# Altium project Triple 1S Battery Charger.PrjPcb
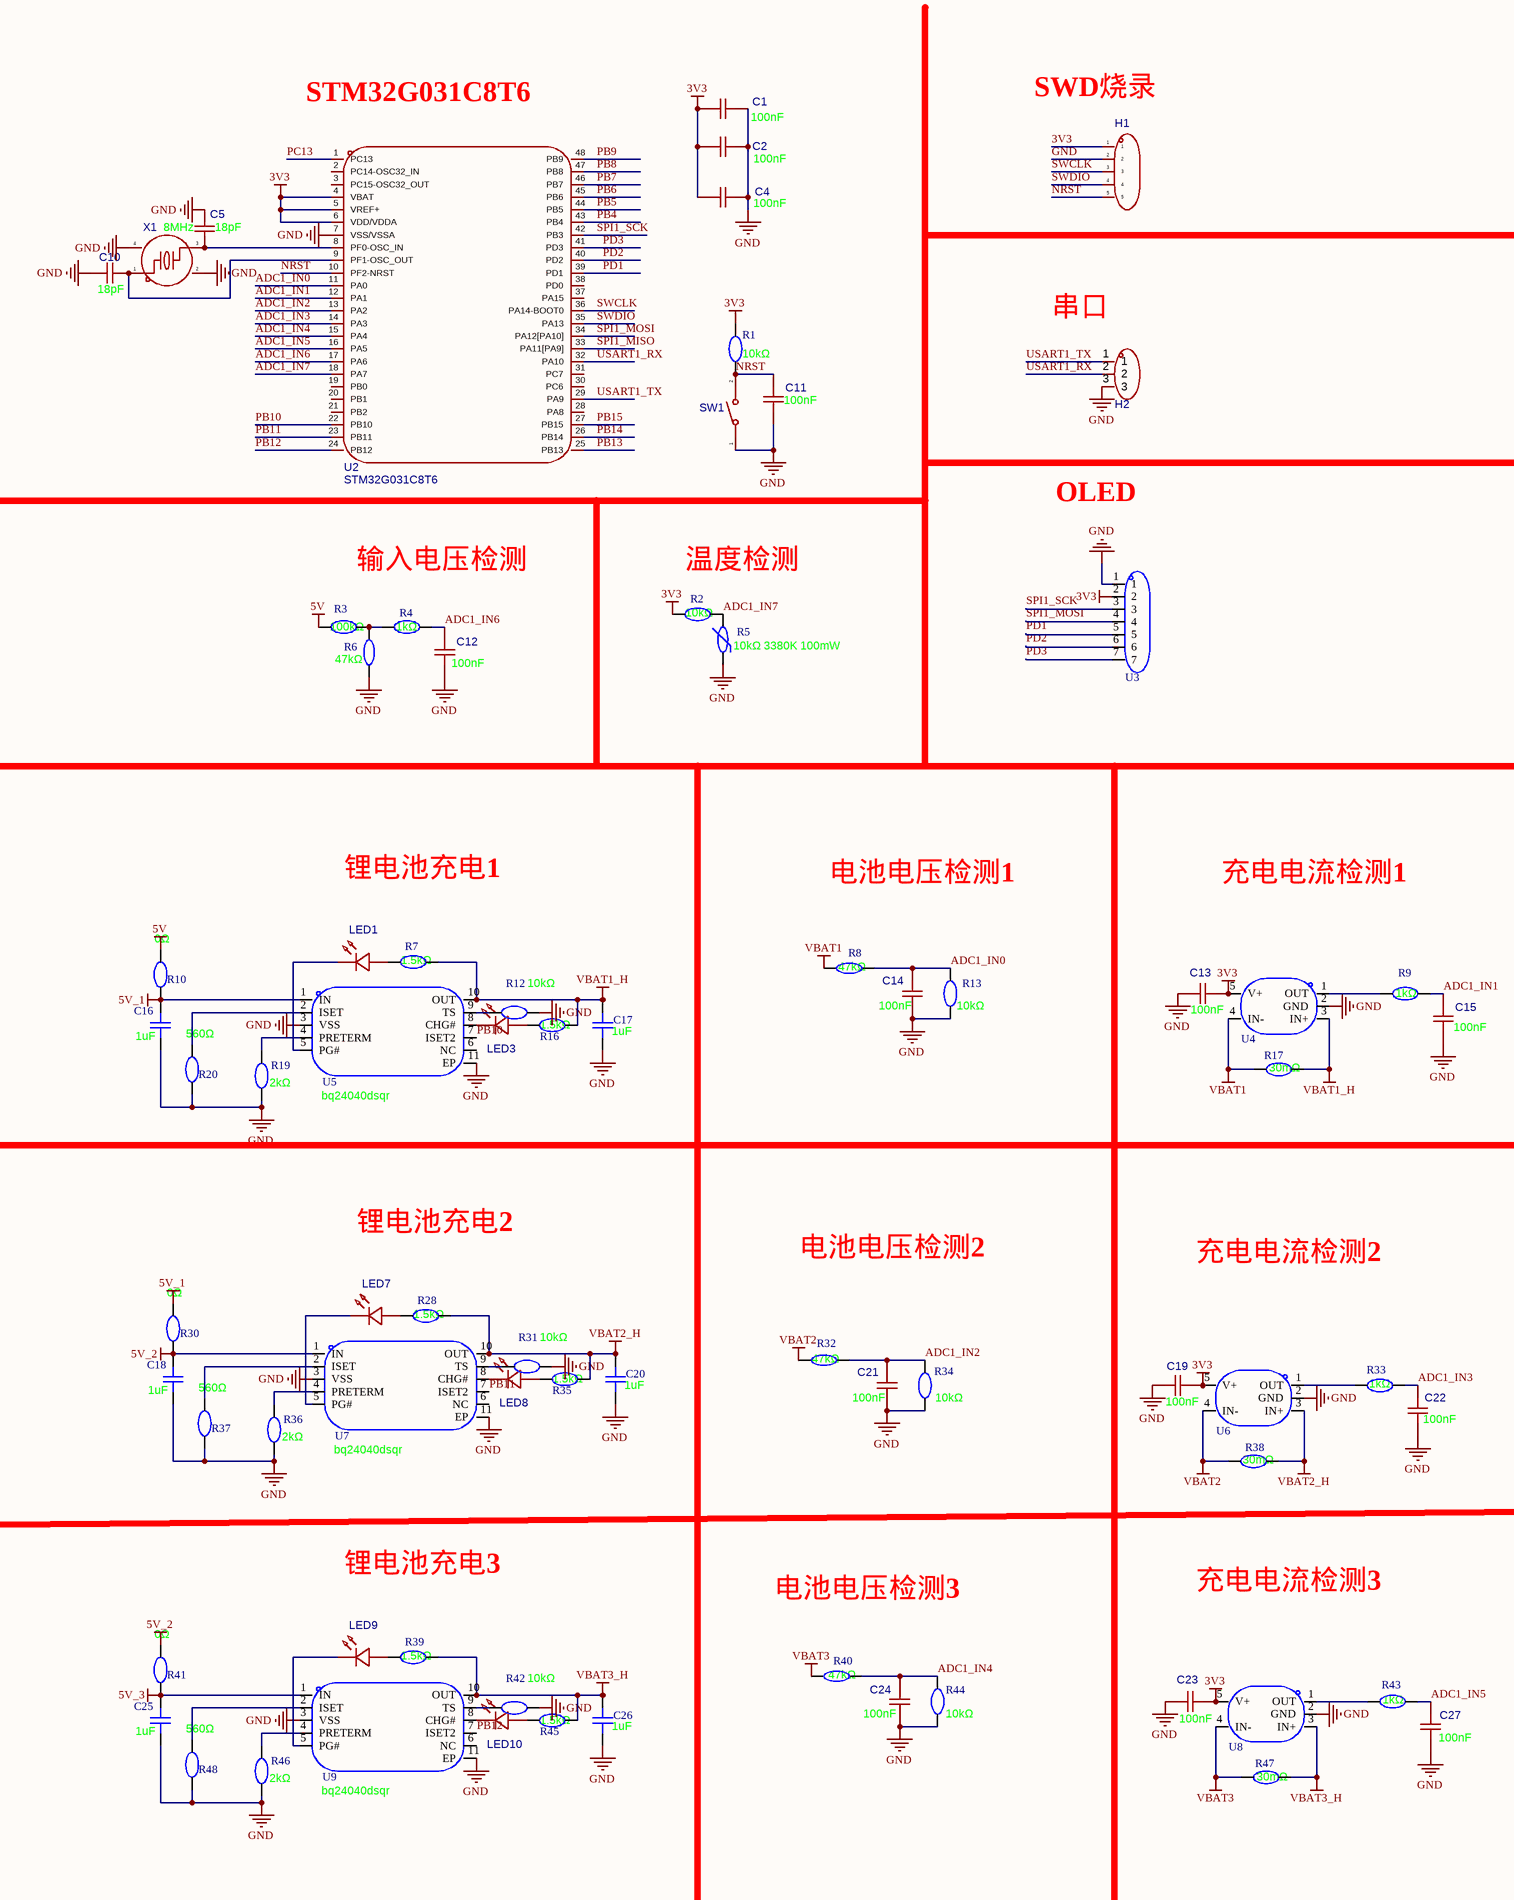
[diagram p0: Sheet1.SchDoc, left]
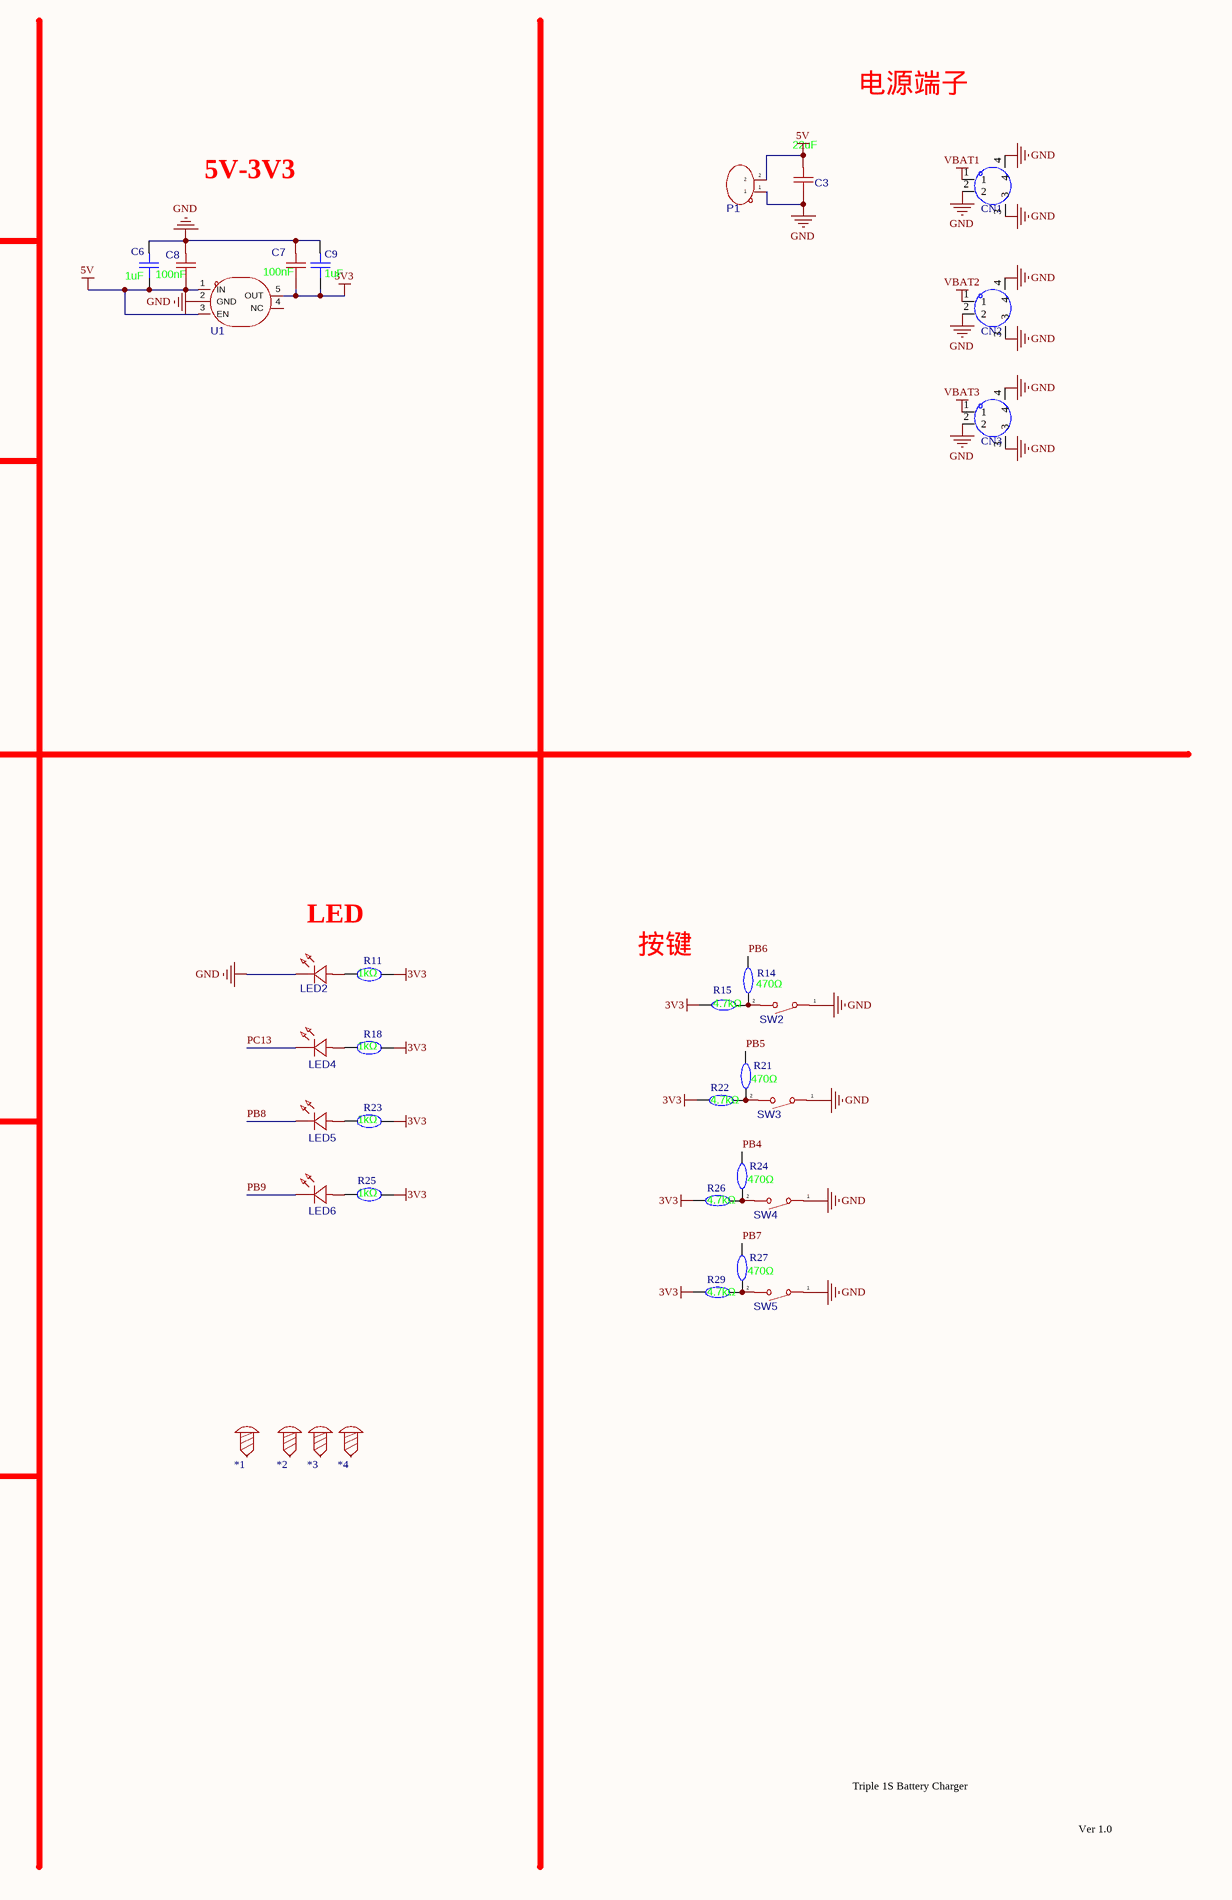
[diagram p1: Sheet1.SchDoc, right]
1 sheet, 110 parts. Net scope: global (net labels, ports and power ports of the same name join across sheets).
Board file: PCB1.PcbDoc

## Sheet Sheet1.SchDoc
size A2; SheetNumber: 1; SheetTotal: 1

### Parts
*1  螺丝孔_1  [M3螺丝]  (value not drawn)
*2  螺丝孔_1  [M3螺丝]  (value not drawn)
*3  螺丝孔_1  [M3螺丝]  (value not drawn)
*4  螺丝孔_1  [M3螺丝]  (value not drawn)
C1  value 100nF  [C0402]  (hidden comment: cc0402krx7r7bb104)
C2  value 100nF  [C0402]  (hidden comment: cc0402krx7r7bb104)
C3  value 22uF  [C0603]  (hidden comment: hgc0603r5226m160nthj)
C4  value 100nF  [C0402]  (hidden comment: cc0402krx7r7bb104)
C5  value 18pF  [C0402]  (hidden comment: cc0402jrnpo9bn180)
C6  value 1uF  [C0402]  (hidden comment: cga0402x5r105k500gt)
C7  value 100nF  [C0402]  (hidden comment: cc0402krx7r7bb104)
C8  value 100nF  [C0402]  (hidden comment: cc0402krx7r7bb104)
C9  value 1uF  [C0402]  (hidden comment: cga0402x5r105k500gt)
C10  value 18pF  [C0402]  (hidden comment: cc0402jrnpo9bn180)
C11  value 100nF  [C0402]  (hidden comment: cc0402krx7r7bb104)
C12  value 100nF  [C0402]  (hidden comment: cc0402krx7r7bb104)
C13  value 100nF  [C0402]  (hidden comment: cc0402krx7r7bb104)
C14  value 100nF  [C0402]  (hidden comment: cc0402krx7r7bb104)
C15  value 100nF  [C0402]  (hidden comment: cc0402krx7r7bb104)
C16  value 1uF  [C0402]  (hidden comment: cga0402x5r105k500gt)
C17  value 1uF  [C0402]  (hidden comment: cga0402x5r105k500gt)
C18  value 1uF  [C0402]  (hidden comment: cga0402x5r105k500gt)
C19  value 100nF  [C0402]  (hidden comment: cc0402krx7r7bb104)
C20  value 1uF  [C0402]  (hidden comment: cga0402x5r105k500gt)
C21  value 100nF  [C0402]  (hidden comment: cc0402krx7r7bb104)
C22  value 100nF  [C0402]  (hidden comment: cc0402krx7r7bb104)
C23  value 100nF  [C0402]  (hidden comment: cc0402krx7r7bb104)
C24  value 100nF  [C0402]  (hidden comment: cc0402krx7r7bb104)
C25  value 1uF  [C0402]  (hidden comment: cga0402x5r105k500gt)
C26  value 1uF  [C0402]  (hidden comment: cga0402x5r105k500gt)
C27  value 100nF  [C0402]  (hidden comment: cc0402krx7r7bb104)
CN1  2.54-2a-lt  [CONN-SMD_2P-P2.54_XH2.54-2AB]  (value not drawn)
CN2  2.54-2a-lt  [CONN-SMD_2P-P2.54_XH2.54-2AB]  (value not drawn)
CN3  2.54-2a-lt  [CONN-SMD_2P-P2.54_XH2.54-2AB]  (value not drawn)
H1  pz254v-11-05p  [HDR-TH_5P-P2.54-V-M]  (value not drawn)
H2  lail-pz2.54-3p-l  [HDR-TH_3P-P2.54-V-M-1]  (value not drawn)
LED1  xl-1005ugc_c965793  [LED0402-RD_GREEN]  (value not drawn)
LED2  xl-1005ugc_c965793  [LED0402-RD_GREEN]  (value not drawn)
LED3  xl-1005ugc_c965793  [LED0402-RD_GREEN]  (value not drawn)
LED4  xl-1005ugc_c965793  [LED0402-RD_GREEN]  (value not drawn)
LED5  xl-1005ugc_c965793  [LED0402-RD_GREEN]  (value not drawn)
LED6  xl-1005ugc_c965793  [LED0402-RD_GREEN]  (value not drawn)
LED7  xl-1005ugc_c965793  [LED0402-RD_GREEN]  (value not drawn)
LED8  xl-1005ugc_c965793  [LED0402-RD_GREEN]  (value not drawn)
LED9  xl-1005ugc_c965793  [LED0402-RD_GREEN]  (value not drawn)
LED10  xl-1005ugc_c965793  [LED0402-RD_GREEN]  (value not drawn)
P1  wj15edgrc-3.81-02p-14-00a  [CONN-TH_2P-P3.81_WJ15EDGRC-3.81-2P]  (value not drawn)
R1  value 10kΩ  [R0402]  (hidden comment: frc0402f1002ts)
R2  value 10kΩ  [R0402]  (hidden comment: frc0402f1002ts)
R3  value 100kΩ  [R0402]  (hidden comment: frc0402f1003ts)
R4  value 1kΩ  [R0402]  (hidden comment: frc0402j102 ts)
R5  LCSC Part Name: 10kΩ 3380K 100mW  [R0402]  (hidden comment: ncp15xh103f03rc)
R6  value 47kΩ  [R0402]  (hidden comment: 0402wgf4702tce)
R7  value 1.5kΩ  [R0402]  (hidden comment: frc0402f1501ts)
R8  value 47kΩ  [R0402]  (hidden comment: 0402wgf4702tce)
R9  value 1kΩ  [R0402]  (hidden comment: frc0402j102 ts)
R10  value 0Ω  [R1206]  (hidden comment: re1206f1r000)
R11  value 1kΩ  [R0402]  (hidden comment: frc0402j102 ts)
R12  value 10kΩ  [R0402]  (hidden comment: frc0402f1002ts)
R13  value 10kΩ  [R0402]  (hidden comment: frc0402f1002ts)
R14  value 470Ω  [R0402]  (hidden comment: 0402wgf4700tce)
R15  value 4.7kΩ  [R0402]  (hidden comment: rc0402fr-074k7l)
R16  value 1.5kΩ  [R0402]  (hidden comment: frc0402f1501ts)
R17  value 30mΩ  [R0805]  (hidden comment: re0805far030)
R18  value 1kΩ  [R0402]  (hidden comment: frc0402j102 ts)
R19  value 2kΩ  [R0402]  (hidden comment: frc0402f2001ts)
R20  value 560Ω  [R0402]  (hidden comment: frc0402f5600ts)
R21  value 470Ω  [R0402]  (hidden comment: 0402wgf4700tce)
R22  value 4.7kΩ  [R0402]  (hidden comment: rc0402fr-074k7l)
R23  value 1kΩ  [R0402]  (hidden comment: frc0402j102 ts)
R24  value 470Ω  [R0402]  (hidden comment: 0402wgf4700tce)
R25  value 1kΩ  [R0402]  (hidden comment: frc0402j102 ts)
R26  value 4.7kΩ  [R0402]  (hidden comment: rc0402fr-074k7l)
R27  value 470Ω  [R0402]  (hidden comment: 0402wgf4700tce)
R28  value 1.5kΩ  [R0402]  (hidden comment: frc0402f1501ts)
R29  value 4.7kΩ  [R0402]  (hidden comment: rc0402fr-074k7l)
R30  value 0Ω  [R1206]  (hidden comment: re1206f1r000)
R31  value 10kΩ  [R0402]  (hidden comment: frc0402f1002ts)
R32  value 47kΩ  [R0402]  (hidden comment: 0402wgf4702tce)
R33  value 1kΩ  [R0402]  (hidden comment: frc0402j102 ts)
R34  value 10kΩ  [R0402]  (hidden comment: frc0402f1002ts)
R35  value 1.5kΩ  [R0402]  (hidden comment: frc0402f1501ts)
R36  value 2kΩ  [R0402]  (hidden comment: frc0402f2001ts)
R37  value 560Ω  [R0402]  (hidden comment: frc0402f5600ts)
R38  value 30mΩ  [R0805]  (hidden comment: re0805far030)
R39  value 1.5kΩ  [R0402]  (hidden comment: frc0402f1501ts)
R40  value 47kΩ  [R0402]  (hidden comment: 0402wgf4702tce)
R41  value 0Ω  [R1206]  (hidden comment: re1206f1r000)
R42  value 10kΩ  [R0402]  (hidden comment: frc0402f1002ts)
R43  value 1kΩ  [R0402]  (hidden comment: frc0402j102 ts)
R44  value 10kΩ  [R0402]  (hidden comment: frc0402f1002ts)
R45  value 1.5kΩ  [R0402]  (hidden comment: frc0402f1501ts)
R46  value 2kΩ  [R0402]  (hidden comment: frc0402f2001ts)
R47  value 30mΩ  [R0805]  (hidden comment: re0805far030)
R48  value 560Ω  [R0402]  (hidden comment: frc0402f5600ts)
SW1  ts-1088-ar02016  [SW-SMD_L3.9-W3.0-P4.45]  (value not drawn)
SW2  ts-1088-ar02016  [SW-SMD_L3.9-W3.0-P4.45]  (value not drawn)
SW3  ts-1088-ar02016  [SW-SMD_L3.9-W3.0-P4.45]  (value not drawn)
SW4  ts-1088-ar02016  [SW-SMD_L3.9-W3.0-P4.45]  (value not drawn)
SW5  ts-1088-ar02016  [SW-SMD_L3.9-W3.0-P4.45]  (value not drawn)
U1  tps7a2033pdbvr  [SOT-23-5_L2.9-W1.6-P0.95-LS2.8-BR]  (value not drawn)
U2  stm32g031c8t6  [LQFP-48_L7.0-W7.0-P0.50-LS9.0-BL]
U3  kh-2.54fh-1x7p-h8.5  [HDR-TH_7P-P2.54-V-F]  (value not drawn)
U4  ina180a3idbvr  [SOT-23-5_L3.0-W1.7-P0.95-LS2.8-BR]  (value not drawn)
U5  bq24040dsqr  [WSON-10_L2.0-W2.0-P0.40-BL-EP]
U6  ina180a3idbvr  [SOT-23-5_L3.0-W1.7-P0.95-LS2.8-BR]  (value not drawn)
U7  bq24040dsqr  [WSON-10_L2.0-W2.0-P0.40-BL-EP]
U8  ina180a3idbvr  [SOT-23-5_L3.0-W1.7-P0.95-LS2.8-BR]  (value not drawn)
U9  bq24040dsqr  [WSON-10_L2.0-W2.0-P0.40-BL-EP]
X1  value 8MHz  [CRYSTAL-SMD_4P-L3.2-W2.5-BL]  (hidden comment: x32258mob4si)

### Nets
3V3: C1.1 C2.1 C4.1 C7.1 C9.1 C13.2 C19.2 C23.2 H1.1 R1.2 R2.1 R11.2 R15.1 R18.2 R22.1 R23.2 R25.2 R26.1 R29.1 U1.5(OUT) U2.4(VBAT) U2.5(VREF+) U2.6(VDD/VDDA) U3.2 U4.5(V+) U6.5(V+) U8.5(V+)
5V: C3.2 C6.1 C8.1 P1.2 R3.1 R10.2 U1.1(IN) U1.3(EN)
5V_1: C16.2 R10.1 R30.2 U5.1(IN)
5V_2: C18.2 R30.1 R41.2 U7.1(IN)
5V_3: C25.2 R41.1 U9.1(IN)
GND: C1.2 C2.2 C3.1 C4.2 C5.2 C6.2 C7.2 C8.2 C9.2 C10.1 C11.1 C12.1 C13.1 C14.2 C15.2 C16.1 C17.1 C18.1 C19.1 C20.1 C21.2 C22.2 C23.1 C24.2 C25.1 C26.1 C27.2 CN1.2 CN1.3 CN1.4 CN2.2 CN2.3 CN2.4 CN3.2 CN3.3 CN3.4 H1.2 H2.3 LED2.1(K) P1.1 R5.1 R6.1 R12.2 R13.2 R19.1 R20.1 R31.2 R34.2 R36.1 R37.1 R42.2 R44.2 R46.1 R48.1 SW1.1 SW2.1 SW3.1 SW4.1 SW5.1 U1.2(GND) U2.7(VSS/VSSA) U3.1 U4.2(GND) U5.3(VSS) U5.11(EP) U6.2(GND) U7.3(VSS) U7.11(EP) U8.2(GND) U9.3(VSS) U9.11(EP) X1.2(GND) X1.4(GND)
VBAT1: CN1.1 R8.1 R17.2 U4.4(IN-)
VBAT1_H: C17.2 R7.2 R16.2 R17.1 U4.3(IN+) U5.10(OUT)
VBAT2: CN2.1 R32.1 R38.2 U6.4(IN-)
VBAT2_H: C20.2 R28.2 R35.2 R38.1 U6.3(IN+) U7.10(OUT)
VBAT3: CN3.1 R40.1 R47.2 U8.4(IN-)
VBAT3_H: C26.2 R39.2 R45.2 R47.1 U8.3(IN+) U9.10(OUT)
ADC1_IN0: C14.1 R8.2 R13.1 U2.11(PA0)
ADC1_IN1: C15.1 R9.2 U2.12(PA1)
ADC1_IN2: C21.1 R32.2 R34.1 U2.13(PA2)
ADC1_IN3: C22.1 R33.2 U2.14(PA3)
ADC1_IN4: C24.1 R40.2 R44.1 U2.15(PA4)
ADC1_IN5: C27.1 R43.2 U2.16(PA5)
ADC1_IN6: C12.2 R4.2 U2.17(PA6)
ADC1_IN7: R2.2 R5.2 U2.18(PA7)
NRST: C11.2 H1.5 R1.1 SW1.2 U2.10(PF2-NRST)
PB4: R24.2 U2.43(PB4)
PB5: R21.2 U2.44(PB5)
PB6: R14.2 U2.45(PB6)
PB7: R27.2 U2.46(PB7)
PB8: LED5.1(K) U2.47(PB8)
PB9: LED6.1(K) U2.48(PB9)
PB10: U2.22(PB10) U5.7(ISET2)
PB11: U2.23(PB11) U7.7(ISET2)
PB12: U2.24(PB12) U9.7(ISET2)
PB13: U2.25(PB13)
PB14: U2.26(PB14)
PB15: U2.27(PB15)
PC13: LED4.1(K) U2.1(PC13)
PD1: U2.39(PD1) U3.5
PD2: U2.40(PD2) U3.6
PD3: U2.41(PD3) U3.7
SPI1_MISO: U2.33(PA11[PA9])
SPI1_MOSI: U2.34(PA12[PA10]) U3.4
SPI1_SCK: U2.42(PB3) U3.3
SWCLK: H1.3 U2.36(PA14-BOOT0)
SWDIO: H1.4 U2.35(PA13)
USART1_RX: H2.2 U2.32(PA10)
USART1_TX: H2.1 U2.29(PA9)
NetC5_1: C5.1 U2.8(PF0-OSC_IN) X1.3
NetC10_2: C10.2 U2.9(PF1-OSC_OUT) X1.1
NetLED1_1: LED1.1(K) U5.5(PG#)
NetLED1_2: LED1.2(A) R7.1
NetLED2_2: LED2.2(A) R11.1
NetLED3_1: LED3.1(K) U5.8(CHG#)
NetLED3_2: LED3.2(A) R16.1
NetLED4_2: LED4.2(A) R18.1
NetLED5_2: LED5.2(A) R23.1
NetLED6_2: LED6.2(A) R25.1
NetLED7_1: LED7.1(K) U7.5(PG#)
NetLED7_2: LED7.2(A) R28.1
NetLED8_1: LED8.1(K) U7.8(CHG#)
NetLED8_2: LED8.2(A) R35.1
NetLED9_1: LED9.1(K) U9.5(PG#)
NetLED9_2: LED9.2(A) R39.1
NetLED10_1: LED10.1(K) U9.8(CHG#)
NetLED10_2: LED10.2(A) R45.1
NetR3_2: R3.2 R4.1 R6.2
NetR9_1: R9.1 U4.1(OUT)
NetR12_1: R12.1 U5.9(TS)
NetR14_1: R14.1 R15.2 SW2.2
NetR19_2: R19.2 U5.4(PRETERM)
NetR20_2: R20.2 U5.2(ISET)
NetR21_1: R21.1 R22.2 SW3.2
NetR24_1: R24.1 R26.2 SW4.2
NetR27_1: R27.1 R29.2 SW5.2
NetR31_1: R31.1 U7.9(TS)
NetR33_1: R33.1 U6.1(OUT)
NetR36_2: R36.2 U7.4(PRETERM)
NetR37_2: R37.2 U7.2(ISET)
NetR42_1: R42.1 U9.9(TS)
NetR43_1: R43.1 U8.1(OUT)
NetR46_2: R46.2 U9.4(PRETERM)
NetR48_2: R48.2 U9.2(ISET)

Not connected (* = marked no-connect by the designer): *1 1; *2 1; *3 1; *4 1; U1 4(NC); U2 2(PC14-OSC32_IN) 3(PC15-OSC32_OUT) 19(PB0) 20(PB1) 21(PB2) 28(PA8) 30(PC6) 31(PC7) 37(PA15) 38(PD0); U5 6(NC); U7 6(NC); U9 6(NC)

### Notes on the sheet
- 电源端子
- STM32G031C8T6
- (near H1) SWD烧录
- 5V-3V3
- 串口
- OLED
- 输入电压检测
- 温度检测
- 锂电池充电1
- 电池电压检测1
- 充电电流检测1
- LED
- 按键
- 锂电池充电2
- 电池电压检测2
- 充电电流检测2
- 锂电池充电3
- 电池电压检测3
- 充电电流检测3
- Triple 1S Battery Charger
- Ver 1.0

### Library data of the parts
C1 C2 C4 C7 C8 C11-C15 C19 C21-C24 C27 = cc0402krx7r7bb104: 容值:100nF;精度:±10%;额定电压:16V;温度系数:X7R;; Manufacturer: YAGEO(国巨); AddInBom: yes; ModelId: 36a51122f27c49738f86b3bfa98863e0; ModelName: C0402_L1.0-W0.5-H0.5; ModelTransform: 39.37,19.685,0,0,0,0,0,0,0; Tolerance: ±10%; Voltage Rating: 16V; Temperature Coefficient: X7R; Symbol: CC0402KRX7R7BB104; LCSC Part Name: 100nF ±10% 16V; SupplierPart: C60474; ManufacturerPart: CC0402KRX7R7BB104; Supplier Footprint: 0402; JLCPCB Part Class: Extended Part; Datasheet: https://item.szlcsc.com/datasheet/CC0402KRX7R7BB104/61526.html; Supplier: LCSC; ConvertToPcb: yes; FootprintName: C0402
C3 = hgc0603r5226m160nthj: 容值:22uF;精度:±20%;额定电压:16V;温度系数:X5R;; Manufacturer: Chinocera(华瓷); AddInBom: yes; ModelId: ac125912035d415993ca9572d50418b1; ModelName: C0603_L1.6-W0.8-H0.8; ModelTransform: 62.992,31.496,0,0,0,0,0,0,0; Tolerance: ±20%; Voltage Rating: 16V; Temperature Coefficient: X5R; Symbol: HGC0603R5226M160NTHJ; LCSC Part Name: 22uF ±20% 16V; SupplierPart: C22367828; ManufacturerPart: HGC0603R5226M160NTHJ; Supplier Footprint: 0603; JLCPCB Part Class: Extended Part; Datasheet: https://item.szlcsc.com/datasheet/HGC0603R5226M160NTHJ/23841133.html; Supplier: LCSC; ConvertToPcb: yes; FootprintName: C0603
C5 C10 = cc0402jrnpo9bn180: 容值:18pF;精度:±5%;额定电压:50V;温度系数:NP0;; Manufacturer: YAGEO(国巨); AddInBom: yes; ModelId: 36a51122f27c49738f86b3bfa98863e0; ModelName: C0402_L1.0-W0.5-H0.5; ModelTransform: 39.37,19.685,0,0,0,0,0,0,0; Tolerance: ±5%; Voltage Rating: 50V; Temperature Coefficient: NP0; Symbol: CC0402JRNPO9BN180; LCSC Part Name: 18pF ±5% 50V; SupplierPart: C106202; ManufacturerPart: CC0402JRNPO9BN180; Supplier Footprint: 0402; JLCPCB Part Class: Extended Part; Datasheet: https://item.szlcsc.com/datasheet/CC0402JRNPO9BN180/107417.html; Supplier: LCSC; ConvertToPcb: yes; FootprintName: C0402
C6 C9 C16-C18 C20 C25 C26 = cga0402x5r105k500gt: 容值:1uF;精度:±10%;额定电压:50V;温度系数:X5R;; Manufacturer: HRE(芯声); AddInBom: yes; ModelId: 36a51122f27c49738f86b3bfa98863e0; ModelName: C0402_L1.0-W0.5-H0.5; ModelTransform: 39.37,19.685,0,0,0,0,0,0,0; Tolerance: ±10%; Voltage Rating: 50V; Temperature Coefficient: X5R; Symbol: CGA0402X5R105K500GT; LCSC Part Name: 1uF ±10% 50V; SupplierPart: C6119811; ManufacturerPart: CGA0402X5R105K500GT; Supplier Footprint: 0402; JLCPCB Part Class: Extended Part; Datasheet: https://item.szlcsc.com/datasheet/CGA0402X5R105K500GT/7062517.html; Supplier: LCSC; ConvertToPcb: yes; FootprintName: C0402
CN1-CN3 = 2.54-2a-lt: 插针结构:1x2P;间距:2.54mm;安装方式:立贴;参考系列:XH;总PIN数:2P;排数:1;每排PIN数:2;行距:-;额定电流:500mA;触头材质:磷铜;触头镀层:锡;工作温度:-25℃~+85℃;; Manufacturer: CAX(创都); AddInBom: yes; ModelId: d8a33bf5c0154e0995c08ba39c3c8f35; ModelName: CONN-SMD_XH2.54-LS-2P; ModelTransform: 393.7,354.33,0,0,0,0,0,9.843,0; Pins Structure: 1x2P; Pitch: 2.54mm; Reference Series: XH; Number of PINs Per Row: 2; Current Rating: 500mA; Voltage Rating: 50V; Plastic Material: LCP; Z-Height of the Board: 7.9mm; Y-Width of Bottom Edge on Board: 6mm; Symbol: 2.54-2A-LT; LCSC Part Name: 1x2P 间距:2.54mm 立贴 系列:XH; SupplierPart: C722695; ManufacturerPart: 2.54-2A-LT; Supplier Footprint: SMD,P=2.54mm; JLCPCB Part Class: Extended Part; Datasheet: https://item.szlcsc.com/datasheet/2.54-2A-LT/766902.html; Supplier: LCSC; ConvertToPcb: yes; FootprintName: CONN-SMD_2P-P2.54_XH2.54-2AB; Mounting Type: 立贴; Number of Pins: 2P; Number of Rows: 1; Row Spacing: -; Contact Material: 磷铜; Contact Plating: 锡; Operating Temperature: -25℃~+85℃; Color: 米色
H1 = pz254v-11-05p: 插针结构:1x5P;间距:2.54mm;行距:-;圆针/方针:方针;安装方式:直插;排数:单排;总PIN位数:5P;额定电流:3A;额定电压:250V;配合针长度:6mm;塑高:2.5mm;端接针长度:3mm;触头材质:黄铜;触头镀层:-;工作温度:-40℃~+105℃;颜色:黑色;; Manufacturer: XFCN(兴飞); AddInBom: yes; ModelId: 47d466e4a34f4fc5bc626cf773a24dd5; ModelName: HDR-TH_5P-P2.54-M-LI-1X5P; ModelTransform: 499.999,100,0,0,0,0,0,0,-118.11; Pin Structure: 1x5P; Pitch: 2.54mm; Circluar Pins/Square Pins: 方针; Current Rating: 3A; Voltage Rating (Max): 250V; Symbol: PZ254V-11-05P; LCSC Part Name: 1x5P 间距:2.54mm 方针 直插; SupplierPart: C492404; ManufacturerPart: PZ254V-11-05P; Supplier Footprint: 插件,P=2.54mm; JLCPCB Part Class: Extended Part; Datasheet: https://item.szlcsc.com/datasheet/PZ254V-11-05P/502960.html; Supplier: LCSC; ConvertToPcb: yes; FootprintName: HDR-TH_5P-P2.54-V-M; Row Spacing: -; Mounting Type: 直插; Number of Rows: 单排; Number of Pins: 5P; Length of Mating Pin: 6mm; Insulation Height: 2.5mm; Length of End Connection Pin: 3mm; Contact Material: 黄铜; Contact Plating: -; Operating Temperature: -40℃~+105℃; Color: 黑色
H2 = lail-pz2.54-3p-l: 插针结构:1x3P;间距:2.54mm;圆针/方针:方针;排数:单排;总PIN位数:3P;额定电流:3A;额定电压:250V;塑高:2.5mm;端接针长度:3mm;触头材质:黄铜;触头镀层:金;工作温度:-25℃~+80℃;颜色:黑色;; Manufacturer: LAILAN(莱联); AddInBom: yes; ModelId: 94a8ffe137b6410295cb18cd3ffd99db; ModelName: HDR-M-2.54_1x3; ModelTransform: 299.9994,100,0,0,0,0,0,0,-118.11; Pin Structure: 1x3P; Pitch: 2.54mm; Circluar Pins/Square Pins: 方针; Current Rating: 3A; Voltage Rating (Max): 250V; LCSC Part Name: 1x3P 间距:2.54mm 方针; SupplierPart: C54950604; ManufacturerPart: LAIL-PZ2.54-3P-L; Supplier Footprint: 插件,P=2.54mm; JLCPCB Part Class: Extended Part; Datasheet: https://item.szlcsc.com/datasheet/LAIL-PZ2.54-3P-L/58519957.html; Supplier: LCSC; ConvertToPcb: yes; SymbolName: LAIL-PZ2.54-3P-L; FootprintName: HDR-TH_3P-P2.54-V-M-1; Number of Rows: 单排; Number of Pins: 3P; Insulation Height: 2.5mm; Length of End Connection Pin: 3mm; Contact Material: 黄铜; Contact Plating: 金; Operating Temperature: -25℃~+80℃; Color: 黑色
LED1-LED10 = xl-1005ugc_c965793: 灯头类型:1.0mmx0.5mm方形灯头;发光颜色:翠绿色;正向压降(Vf):3V;功率:80mW;正向电流:25mA;波长:516nm~531nm;二极管配置:独立二极管;透镜颜色:无色透明透镜;色温:-;发光强度:249mcd;发光角度:120°;载带方式:正贴;工作温度:-40℃~+85℃;; Manufacturer: XINGLIGHT(成兴光); AddInBom: yes; ModelId: 080bb9bd520f4b34ac21e218e7b036d6; ModelName: LED0402_L1.0-W0.5-H0.2; ModelTransform: 40.1574,19.685,0,0,0,0,0,-0.0005,0; Illumination Color: 翠绿色; Voltage - Forward(Vf): 3V; Power(Watts): 80mW; Forward Current: 25mA; Peak Wavelength: 531nm; Diode Configuration: 独立二极管; Lens Color: 无色透明透镜; Luminous Intensity: 249mcd; Viewing Angle: 120°; Symbol: XL-1005UGC; LCSC Part Name: 0402翠绿贴片式发光二极管; SupplierPart: C965793; ManufacturerPart: XL-1005UGC; Supplier Footprint: 0402; JLCPCB Part Class: Extended Part; Datasheet: https://item.szlcsc.com/datasheet/XL-1005UGC/1051402.html; Supplier: LCSC; ConvertToPcb: yes; FootprintName: LED0402-RD_GREEN; Lamp Holder Type: 1.0mmx0.5mm方形灯头; Wavelength - Dominant: 516nm~531nm; Color Temperature: -; Mounting Style: 正贴; Operating Temperature: -40℃~+85℃
P1 = wj15edgrc-3.81-02p-14-00a: 连接器类型:板端/插座-闭口;固定方式:无固定装置;结构:1x2P;间距:3.81mm;颜色:绿色;安装方式:弯插;排数:1;每排PIN数:2;额定电流:8A;额定电压:300V;线规 - AWG:-;线规 - 平方毫米:-;工作温度:-40℃~+105℃;; Manufacturer: KANGNEX(康奈克斯电气); Symbol: WJ15EDGRC-3.81-2P; AddInBom: yes; ModelId: 816ec8aca6fe4785be70cb4c5121258d; ModelName: CONN-TH_2P_L8.5-W9.2-H7.0-P3.81; ModelTransform: 334.645,360.2355,0,0,0,0,0,-118.11,-137.795; Number of Positions or Pins: 1x2P; Pitch: 3.81mm; Number of PINs Per Row: 2; Current Rating: 8A; Voltage Rating (Max): 300V; LCSC Part Name: 无固定装置 1x2P 3.81mm 排数:1 每排P数:2; SupplierPart: C8387; ManufacturerPart: WJ15EDGRC-3.81-02P-14-00A; Supplier Footprint: 弯插,P=3.81mm; JLCPCB Part Class: Extended Part; Datasheet: https://item.szlcsc.com/datasheet/WJ15EDGRC-3.81-02P-14-00A/8881.html; Supplier: LCSC; ConvertToPcb: yes; FootprintName: CONN-TH_2P-P3.81_WJ15EDGRC-3.81-2P; Connector Type: 板端/插座-闭口; Termination Style: 无固定装置; Color: 绿色; Mounting Type: 弯插; Number of Pins: 2P; Number of Rows: 1; Wire Gauge - AWG: -; Wire Gauge - mm2: -; Operating Temperature: -40℃~+105℃; Connection Type: -; Outlet Direction (Vertical Basis): -
R1 R2 R12 R13 R31 R34 R42 R44 = frc0402f1002ts: 电阻类型:厚膜电阻;阻值:10kΩ;精度:±1%;功率:62.5mW;工作电压:50V;温度系数:±100ppm/℃;; Manufacturer: FOJAN(富捷); AddInBom: yes; ModelId: 98c88bc2b9094f218f3a3e30a7012738; ModelName: R0402_L1.0-W0.5-H0.4; ModelTransform: 39.37,19.685,0,0,0,0,0,0,0; Tolerance: ±1%; Power(Watts): 62.5mW; Voltage-Supply(Max): 50V; Symbol: FRC0402F1002TS; LCSC Part Name: 10kΩ ±1% 62.5mW 厚膜电阻; SupplierPart: C2906861; ManufacturerPart: FRC0402F1002TS; Supplier Footprint: 0402; JLCPCB Part Class: Extended Part; Datasheet: https://item.szlcsc.com/datasheet/FRC0402F1002TS/3180374.html; Supplier: LCSC; ConvertToPcb: yes; FootprintName: R0402; Type: 厚膜电阻; Temperature Coefficient: ±100ppm/℃; Operating Temperature: -55℃~+155℃
R3 = frc0402f1003ts: 电阻类型:厚膜电阻;阻值:100kΩ;精度:±1%;功率:62.5mW;工作电压:50V;温度系数:±100ppm/℃;; Manufacturer: FOJAN(富捷); AddInBom: yes; ModelId: 98c88bc2b9094f218f3a3e30a7012738; ModelName: R0402_L1.0-W0.5-H0.4; ModelTransform: 39.37,19.685,0,0,0,0,0,0,0; Tolerance: ±1%; Power(Watts): 62.5mW; Voltage-Supply(Max): 50V; Symbol: FRC0402F1003TS; LCSC Part Name: 100kΩ ±1% 62.5mW 厚膜电阻; SupplierPart: C2906859; ManufacturerPart: FRC0402F1003TS; Supplier Footprint: 0402; JLCPCB Part Class: Extended Part; Datasheet: https://item.szlcsc.com/datasheet/FRC0402F1003TS/3180372.html; Supplier: LCSC; ConvertToPcb: yes; FootprintName: R0402; Type: 厚膜电阻; Temperature Coefficient: ±100ppm/℃; Operating Temperature: -55℃~+155℃
R4 R9 R11 R18 R23 R25 R33 R43 = frc0402j102 ts: 电阻类型:厚膜电阻;阻值:1kΩ;精度:±5%;功率:62.5mW;工作电压:50V;温度系数:±100ppm/℃;; Manufacturer: FOJAN(富捷); AddInBom: yes; ModelId: 98c88bc2b9094f218f3a3e30a7012738; ModelName: R0402_L1.0-W0.5-H0.4; ModelTransform: 39.37,19.685,0,0,0,0,0,0,0; Tolerance: ±5%; Power(Watts): 62.5mW; Voltage-Supply(Max): 50V; Symbol: FRC0402J102 TS; LCSC Part Name: 1kΩ ±5% 62.5mW 厚膜电阻; SupplierPart: C2906899; ManufacturerPart: FRC0402J102 TS; Supplier Footprint: 0402; JLCPCB Part Class: Extended Part; Datasheet: https://item.szlcsc.com/datasheet/FRC0402J102%2520TS/3180412.html; Supplier: LCSC; ConvertToPcb: yes; FootprintName: R0402; Type: 厚膜电阻; Temperature Coefficient: ±100ppm/℃; Operating Temperature: -55℃~+155℃
R5 = ncp15xh103f03rc: 阻值:10kΩ;B值(25℃/50℃):3380K;电阻精度:±1%;功率:100mW;B值精度:±1%;最大稳态电流(25℃):310uA;; Manufacturer: muRata(村田); AddInBom: yes; ModelId: 98c88bc2b9094f218f3a3e30a7012738; ModelName: R0402_L1.0-W0.5-H0.4; ModelTransform: 39.37,19.685,0,0,0,0,0,0,0; Resistance @ 25℃: 10kΩ; B Constant (25℃/50℃): 3380K; Resistance Tolerance: ±1%; B Constant (25℃/85℃): 3434K; B Constant (25℃/100℃): 3455K; Power(Watts): 100mW; Steady State Current (Max): 310uA; Dissipation Factor: 1mW/℃; Symbol: NCP15XH103F03RC; SupplierPart: C77131; ManufacturerPart: NCP15XH103F03RC; Supplier Footprint: 0402; JLCPCB Part Class: Extended Part; Datasheet: https://item.szlcsc.com/datasheet/NCP15XH103F03RC/78258.html; Supplier: LCSC; ConvertToPcb: yes; FootprintName: R0402; B Constant (25℃/75℃): -; B Constant Tolerance: ±1%; Operating Temperature: -40℃~+125℃; Length: 1mm; Width: 0.5mm
R6 R8 R32 R40 = 0402wgf4702tce: 电阻类型:厚膜电阻;阻值:47kΩ;精度:±1%;功率:62.5mW;工作电压:50V;温度系数:±100ppm/℃;; Manufacturer: UNI-ROYAL(厚声); AddInBom: yes; ModelId: 98c88bc2b9094f218f3a3e30a7012738; ModelName: R0402_L1.0-W0.5-H0.4; ModelTransform: 39.37,19.685,0,0,0,0,0,0,0; Tolerance: ±1%; Power(Watts): 62.5mW; Voltage-Supply(Max): 50V; Symbol: 0402WGF4702TCE; LCSC Part Name: 厚膜电阻 47kΩ ±1%; SupplierPart: C25792; ManufacturerPart: 0402WGF4702TCE; Supplier Footprint: 0402; JLCPCB Part Class: Basic Part; Datasheet: https://item.szlcsc.com/datasheet/0402WGF4702TCE/26535.html; Supplier: LCSC; ConvertToPcb: yes; FootprintName: R0402; Type: 厚膜电阻; Temperature Coefficient: ±100ppm/℃; Operating Temperature: -55℃~+155℃
R7 R16 R28 R35 R39 R45 = frc0402f1501ts: 电阻类型:厚膜电阻;阻值:1.5kΩ;精度:±1%;功率:62.5mW;工作电压:50V;温度系数:±100ppm/℃;; Manufacturer: FOJAN(富捷); AddInBom: yes; ModelId: 98c88bc2b9094f218f3a3e30a7012738; ModelName: R0402_L1.0-W0.5-H0.4; ModelTransform: 39.37,19.685,0,0,0,0,0,0,0; Tolerance: ±1%; Power(Watts): 62.5mW; Voltage-Supply(Max): 50V; Symbol: FRC0402F1501TS; LCSC Part Name: 1.5kΩ ±1% 62.5mW 厚膜电阻; SupplierPart: C2933074; ManufacturerPart: FRC0402F1501TS; Supplier Footprint: 0402; JLCPCB Part Class: Extended Part; Datasheet: https://item.szlcsc.com/datasheet/FRC0402F1501TS/3279176.html; Supplier: LCSC; ConvertToPcb: yes; FootprintName: R0402; Type: 厚膜电阻; Temperature Coefficient: ±100ppm/℃; Operating Temperature: -55℃~+155℃
R10 R30 R41 = re1206f1r000: 电阻类型:采样电阻；合金电阻;阻值:0Ω;精度:±1%;功率:1W;安装方式:贴片;; Manufacturer: JIERR(捷而瑞); AddInBom: yes; ModelId: 89a1f13db2384da588040e0b3c55bf66; ModelName: R1206_L3.2-W1.6-H0.6; ModelTransform: 125.984,62.992,0,0,0,0,0,0,0; Tolerance: ±1%; Power(Watts): 1W; Symbol: RE1206F1R000; LCSC Part Name: 0Ω 1W 1206 ±1%; SupplierPart: C46961765; ManufacturerPart: RE1206F1R000; Supplier Footprint: 1206; JLCPCB Part Class: Extended Part; Datasheet: https://item.szlcsc.com/datasheet/RE1206F1R000/49133304.html; Supplier: LCSC; ConvertToPcb: yes; FootprintName: R1206; Type: 采样电阻；合金电阻; Mounting Type: 贴片
R14 R21 R24 R27 = 0402wgf4700tce: 电阻类型:厚膜电阻;阻值:470Ω;精度:±1%;功率:62.5mW;工作电压:50V;温度系数:±100ppm/℃;; Manufacturer: UNI-ROYAL(厚声); AddInBom: yes; ModelId: 98c88bc2b9094f218f3a3e30a7012738; ModelName: R0402_L1.0-W0.5-H0.4; ModelTransform: 39.37,19.685,0,0,0,0,0,0,0; Tolerance: ±1%; Power(Watts): 62.5mW; Voltage-Supply(Max): 50V; Symbol: 0402WGF4700TCE; LCSC Part Name: 厚膜电阻 470Ω ±1%; SupplierPart: C25117; ManufacturerPart: 0402WGF4700TCE; Supplier Footprint: 0402; JLCPCB Part Class: Basic Part; Datasheet: https://item.szlcsc.com/datasheet/0402WGF4700TCE/25860.html; Supplier: LCSC; ConvertToPcb: yes; FootprintName: R0402; Type: 厚膜电阻; Temperature Coefficient: ±100ppm/℃; Operating Temperature: -55℃~+155℃
R15 R22 R26 R29 = rc0402fr-074k7l: 电阻类型:厚膜电阻;阻值:4.7kΩ;精度:±1%;功率:62.5mW;工作电压:50V;温度系数:±100ppm/℃;; Manufacturer: YAGEO(国巨); AddInBom: yes; ModelId: 98c88bc2b9094f218f3a3e30a7012738; ModelName: R0402_L1.0-W0.5-H0.4; ModelTransform: 39.37,19.685,0,0,0,0,0,0,0; Tolerance: ±1%; Power(Watts): 62.5mW; Voltage-Supply(Max): 50V; Symbol: RC0402FR-074K7L; LCSC Part Name: 厚膜电阻 4.7kΩ ±1% 62.5mW; SupplierPart: C105871; ManufacturerPart: RC0402FR-074K7L; Supplier Footprint: 0402; JLCPCB Part Class: Extended Part; Datasheet: https://item.szlcsc.com/datasheet/RC0402FR-074K7L/107086.html; Supplier: LCSC; ConvertToPcb: yes; FootprintName: R0402; Type: 厚膜电阻; Temperature Coefficient: ±100ppm/℃; Operating Temperature: -55℃~+155℃
R17 R38 R47 = re0805far030: 电阻类型:合金电阻;阻值:30mΩ;精度:±1%;功率:500mW;温度系数:±50ppm/℃;安装方式:贴片;; Manufacturer: JIERR(捷而瑞); AddInBom: yes; ModelId: 37a81e68749a4138bd2dfa6897b24b85; ModelName: R0805_L2.0-W1.3-H0.6; ModelTransform: 78.74,51.181,0,0,0,0,0,-0.0005,0; Tolerance: ±1%; Power(Watts): 500mW; Symbol: RE0805FAR030; LCSC Part Name: 30mΩ 0.5W 0805 ±1%; SupplierPart: C51934135; ManufacturerPart: RE0805FAR030; Supplier Footprint: 0805; JLCPCB Part Class: Extended Part; Datasheet: https://item.szlcsc.com/datasheet/RE0805FAR030/54649547.html; Supplier: LCSC; ConvertToPcb: yes; FootprintName: R0805; Type: 合金电阻; Temperature Coefficient: ±50ppm/℃; Mounting Type: 贴片
R19 R36 R46 = frc0402f2001ts: 电阻类型:厚膜电阻;阻值:2kΩ;精度:±1%;功率:62.5mW;工作电压:50V;温度系数:±100ppm/℃;; Manufacturer: FOJAN(富捷); AddInBom: yes; ModelId: 98c88bc2b9094f218f3a3e30a7012738; ModelName: R0402_L1.0-W0.5-H0.4; ModelTransform: 39.37,19.685,0,0,0,0,0,0,0; Tolerance: ±1%; Power(Watts): 62.5mW; Voltage-Supply(Max): 50V; Symbol: FRC0402F2001TS; LCSC Part Name: 2kΩ ±1% 62.5mW 厚膜电阻; SupplierPart: C2909344; ManufacturerPart: FRC0402F2001TS; Supplier Footprint: 0402; JLCPCB Part Class: Extended Part; Datasheet: https://item.szlcsc.com/datasheet/FRC0402F2001TS/3186279.html; Supplier: LCSC; ConvertToPcb: yes; FootprintName: R0402; Type: 厚膜电阻; Temperature Coefficient: ±100ppm/℃; Operating Temperature: -55℃~+155℃
R20 R37 R48 = frc0402f5600ts: 电阻类型:厚膜电阻;阻值:560Ω;精度:±1%;功率:62.5mW;工作电压:50V;温度系数:±100ppm/℃;; Manufacturer: FOJAN(富捷); AddInBom: yes; ModelId: 98c88bc2b9094f218f3a3e30a7012738; ModelName: R0402_L1.0-W0.5-H0.4; ModelTransform: 39.37,19.685,0,0,0,0,0,0,0; Tolerance: ±1%; Power(Watts): 62.5mW; Voltage-Supply(Max): 50V; Symbol: FRC0402F5600TS; LCSC Part Name: 560Ω ±1% 62.5mW 厚膜电阻; SupplierPart: C2909370; ManufacturerPart: FRC0402F5600TS; Supplier Footprint: 0402; JLCPCB Part Class: Extended Part; Datasheet: https://item.szlcsc.com/datasheet/FRC0402F5600TS/3186305.html; Supplier: LCSC; ConvertToPcb: yes; FootprintName: R0402; Type: 厚膜电阻; Temperature Coefficient: ±100ppm/℃; Operating Temperature: -55℃~+155℃
SW1-SW5 = ts-1088-ar02016: 电路结构:单刀单掷;按钮形状:圆形按钮;作用力:1.6N;安装方式:立贴;开关长度:3.9mm;开关宽度:3mm;开关高度:2mm;带支架:不带支架;触点电流:50mA;额定电压:12V;带灯:-;工作寿命:10万次;; Manufacturer: XUNPU(讯普); AddInBom: yes; ModelId: b26698b69f274ffabef8a26c7d0e5dd1; ModelName: SW-SMD_L3.9-W2.9-H2.0-LS4.8; ModelTransform: 188.976,114.174,0,0,0,0,0,0,0; Circuit: 单刀单掷; Actuator Style: 圆形按钮; Operating Force: 1.6N; Switch Height: 2mm; with Bracket: 不带支架; Contact Current: 50mA; Voltage Rating: 12V; Actuator/Cap Color: 黑色; Life: 10万次; Symbol: TS-1088-AR02016; LCSC Part Name: 3.9*3*2mm 立贴 轻触开关; SupplierPart: C720477; ManufacturerPart: TS-1088-AR02016; Supplier Footprint: SMD,4x3mm; JLCPCB Part Class: Basic Part; Datasheet: https://item.szlcsc.com/datasheet/TS-1088-AR02016/763484.html; Supplier: LCSC; ConvertToPcb: yes; FootprintName: SW-SMD_L3.9-W3.0-P4.45; Mounting Type: 立贴; Length: 3.9mm; Width: 3mm; With Lamp: -; IP Rating: -; Termination Style: SMD接片; Operating Temperature: -30℃~+80℃
U1 = tps7a2033pdbvr: 输出类型:固定;最大输入电压:6V;输出电压:3.3V;输出电流:300mA;输出极性:正极;; Manufacturer: TI(德州仪器); AddInBom: yes; ModelId: 7ba65df16e7b4570af156e925f9c37fe; ModelTransform: 114.173,114.173,0,90,0,0,0,0,0; Output Type: 固定; Maximum Input Voltage: 6V; Output Voltage: 3.3V; Output Current: 300mA; Dropout Voltage: 140mV@(300mA); standby current: 15uA; Output Polarity: 正极; Number of Outputs: 1; Symbol: TPS7A2033PDBVR; LCSC Part Name: 具有高 PSRR 的 300mA、超低噪声、低 IQ、低压降 (LDO) 线性稳压器; SupplierPart: C2862740; ManufacturerPart: TPS7A2033PDBVR; Supplier Footprint: SOT-23-5; JLCPCB Part Class: Extended Part; Datasheet: https://www.ti.com/cn/lit/gpn/tps7a20; Supplier: LCSC; ConvertToPcb: yes; FootprintName: SOT-23-5_L2.9-W1.6-P0.95-LS2.8-BR; ModelName: SOT-23-5_L2.9-W1.6-P0.95-LS2.8-BR; Feature: 防静电保护；软启动；浪涌保护；低ESR；热保护(TSD)；欠压闭锁；过流保护(OCP)；带使能；防倒灌; Operating Temperature: -40℃~+125℃@(Tj)
U2 = stm32g031c8t6: CPU内核:ARM Cortex-M0+;CPU最大主频:64MHz;CPU位数:32 Bit;; Manufacturer: ST(意法半导体); AddInBom: yes; ModelId: 093be70396ff421eb2cdb946d5311efc; ModelName: LQFP-48_L7.0-W7.0-H1.4-LS9.0-P0.50; ModelTransform: 354.331,354.331,0,0,0,0,0,0,0; CPU Maximum Speed: 64MHz; Core Size: 32 Bit; Program Storage Size: 64KB; Program Memory Type: FLASH; RAM Size: 8KB; Number of I/O: 44; ADC (Bit): 12bit; Oscillator Type: 内置+外置; Voltage - Supply: 1.7V~3.6V; Symbol: STM32G031C8T6; LCSC Part Name: 主流Arm Cortex-M0+ MCU，具有64 KB Flash存储器、8 KB RAM、64 MHz CPU、2x USART、定时器、ADC和通信接口，1.7-3.6V; SupplierPart: C432205; ManufacturerPart: STM32G031C8T6; Supplier Footprint: LQFP-48(7x7); JLCPCB Part Class: Extended Part; Datasheet: https://item.szlcsc.com/datasheet/STM32G031C8T6/428993.html; Supplier: LCSC; ConvertToPcb: yes; FootprintName: LQFP-48_L7.0-W7.0-P0.50-LS9.0-BL; CPU Core: ARM Cortex-M0+; EEPROM: -; Operating Temperature: -40℃~+85℃
U3 = kh-2.54fh-1x7p-h8.5: 插孔结构:1x7P;间距:2.54mm;行距:-;圆孔/方孔:方孔;安装方式:直插;排数:单排;总孔位数:7P;额定电流:3A;额定电压:-;插孔方向:顶部;塑高:8.5mm;工作温度:-40℃~+105℃;; Manufacturer: kinghelm(金航标); AddInBom: yes; ModelId: 4c31987253bc43b9b52c17be2a6d3f91; ModelName: HDR-TH_7P-P2.54-F-LI-1X7P; ModelTransform: 715.7466,94.488,0,0,0,0,0,0,-118.11; Holes Structure: 1x7P; Pitch: 2.54mm; Circular Hole / Square Hole: 方孔; Number of Positions: 7P; Current Rating: 3A; Holes Direction: 顶部; Symbol: KH-2.54FH-1X7P-H8.5; LCSC Part Name: 间距:2.54mm 1x7P 直插; SupplierPart: C2932672; ManufacturerPart: KH-2.54FH-1X7P-H8.5; Supplier Footprint: 插件,P=2.54mm; JLCPCB Part Class: Extended Part; Datasheet: https://item.szlcsc.com/datasheet/KH-2.54FH-1X7P-H8.5/3278193.html; Supplier: LCSC; ConvertToPcb: yes; FootprintName: HDR-TH_7P-P2.54-V-F; Row Spacing: -; Mounting Type: 直插; Number of Rows: 单排; Voltage Rating (Max): -; Insulation Height: 8.5mm; Operating Temperature: -40℃~+105℃
U4 U6 U8 = ina180a3idbvr: 放大器数:1;共模电压:-200mV~26V;增益:100V/V;带宽(-3db):150kHz;; Manufacturer: TI(德州仪器); AddInBom: yes; ModelId: 0a2a1b8f50944f73965918ad6e5fe167; ModelName: SOT-23-5_L2.9-W1.6-H1.1-LS2.8-P0.95; ModelTransform: 114.173,109.636,0,180,0,0,0,0,0; Number of Channels: 1; Gain: 100V/V; Bandwidth: 150kHz; Ib - Input Bias Current: 100nA; Vos - Input Offset Voltage: 25uV; Differential Voltage: ±26V; Single Supply: 2.7V~5.5V; Quiescent Current: 197uA; Output Current: 8mA; Input Offset Voltage Drift(Vos TC): 1uV/℃; Slew Rate: 2V/us; Common Mode Rejection Ratio (CMRR): 100dB; Noise density(eN): 40nV/√Hz@1kHz; Symbol: INA180A3IDBVR; LCSC Part Name: 高低侧电压输出电流检测放大器; SupplierPart: C122882; ManufacturerPart: INA180A3IDBVR; Supplier Footprint: SOT-23-5; JLCPCB Part Class: Extended Part; Datasheet: https://www.ti.com/cn/lit/ds/symlink/ina180.pdf; Supplier: LCSC; ConvertToPcb: yes; FootprintName: SOT-23-5_L3.0-W1.7-P0.95-LS2.8-BR; Vcm - Common Mode Voltage: -200mV~26V; Operating Temperature: -40℃~+125℃; Dual Supply: -; Features: 模拟输出接口；高边检测；低边检测
U5 U7 U9 = bq24040dsqr: 工作电压:3.5V~28V;最大充电电流:1A;电池类型:锂电池;电池节数:1;; Manufacturer: TI(德州仪器); AddInBom: yes; ModelId: 0e1275d2e7d54e69a402a354e9203fe9; ModelName: WSON-10_L2.0-W2.0-H0.8-P0.40; ModelTransform: 78.74,79.527,0,0,0,0,0,0,0; The Chip Type: 充电芯片; Charge Current - Max: 1A; Charging Saturation Voltage: 4.2V; End-Off Voltage: 800mV; Type of Battery: 锂电池; Number of Cells: 1; Battery Temperature Detection: 支持; Supply Current (Iq): 1mA; Symbol: BQ24040DSQR; LCSC Part Name: 1A单输入单节锂离子和锂聚合物电池充电器; SupplierPart: C81080; ManufacturerPart: BQ24040DSQR; Supplier Footprint: WSON-10-EP(2x2); JLCPCB Part Class: Extended Part; Datasheet: https://www.ti.com/cn/lit/ds/symlink/bq24040.pdf; Supplier: LCSC; ConvertToPcb: yes; FootprintName: WSON-10_L2.0-W2.0-P0.40-BL-EP; Voltage - Supply: 3.5V~28V; Operating Temperature: 0℃~+125℃; 0V Battery Charge: 支持; Balance Current: -; Interface: -; Features: 过流保护；恒压充电；恒流充电；自动再充电；充电终止；可编程充电电流；过压保护；欠压锁定；涓流充电；短路保护
X1 = x32258mob4si: 晶振类型:贴片晶振;频率:8MHz;常温频差:±10ppm;负载电容:12pF;频率稳定度:±20ppm;; Manufacturer: YXC(扬兴晶振); AddInBom: yes; ModelId: ff2dfd5650294453a14147960efe1838; ModelTransform: 125.984,98.425,0,0,0,0,0,0,0; Normal temperature Frequency Tolerance: ±10ppm; Load Capacitance: 12pF; Frequency Stability: ±20ppm; Equivalent Series Resistance(ESR): 180Ω; Symbol: X32258MOB4SI; LCSC Part Name: YSX321SL 8MHZ 4P 3225 12PF ±10PPM -40~85℃ (±20PPM); SupplierPart: C2682775; ManufacturerPart: X32258MOB4SI; Supplier Footprint: SMD3225-4P; JLCPCB Part Class: Extended Part; Datasheet: https://item.szlcsc.com/datasheet/X32258MOB4SI/2777872.html; Supplier: LCSC; ConvertToPcb: yes; FootprintName: CRYSTAL-SMD_4P-L3.2-W2.5-BL; ModelName: CRYSTAL-SMD_4P-L3.2-W2.5-BL; Type: 贴片晶振; Operating Temperature: -40℃~+85℃